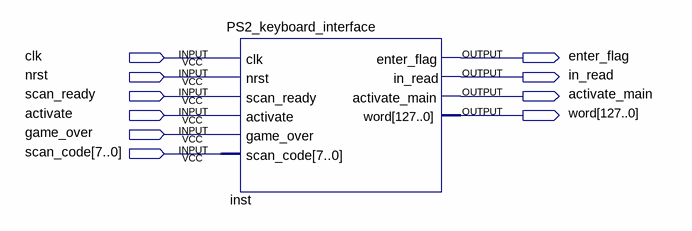
[diagram p0: schematic sheet]
// Quartus schematic keyboard_interface_test.bdf as structural Verilog: 1 symbols, 10 pins
module keyboard_interface_test (
  input  clk,
  input  nrst,
  input  scan_ready,
  input  activate,
  input  game_over,
  input  [7:0] scan_code,
  output enter_flag,
  output in_read,
  output activate_main,
  output [127:0] word
);

  PS2_keyboard_interface inst (
    .clk(clk), .nrst(nrst), .scan_ready(scan_ready), .activate(activate), .game_over(game_over),
    .scan_code(scan_code), .enter_flag(enter_flag), .in_read(in_read), .activate_main(activate_main),
    .word(word));
endmodule
